# Altium project MVP-Dash-v1.0.PrjPcb (part 15 of 15)

## Sheet Connector-Sheet.SchDoc
size 420 x 297 mm; SheetNumber: 25; SheetTotal: 25
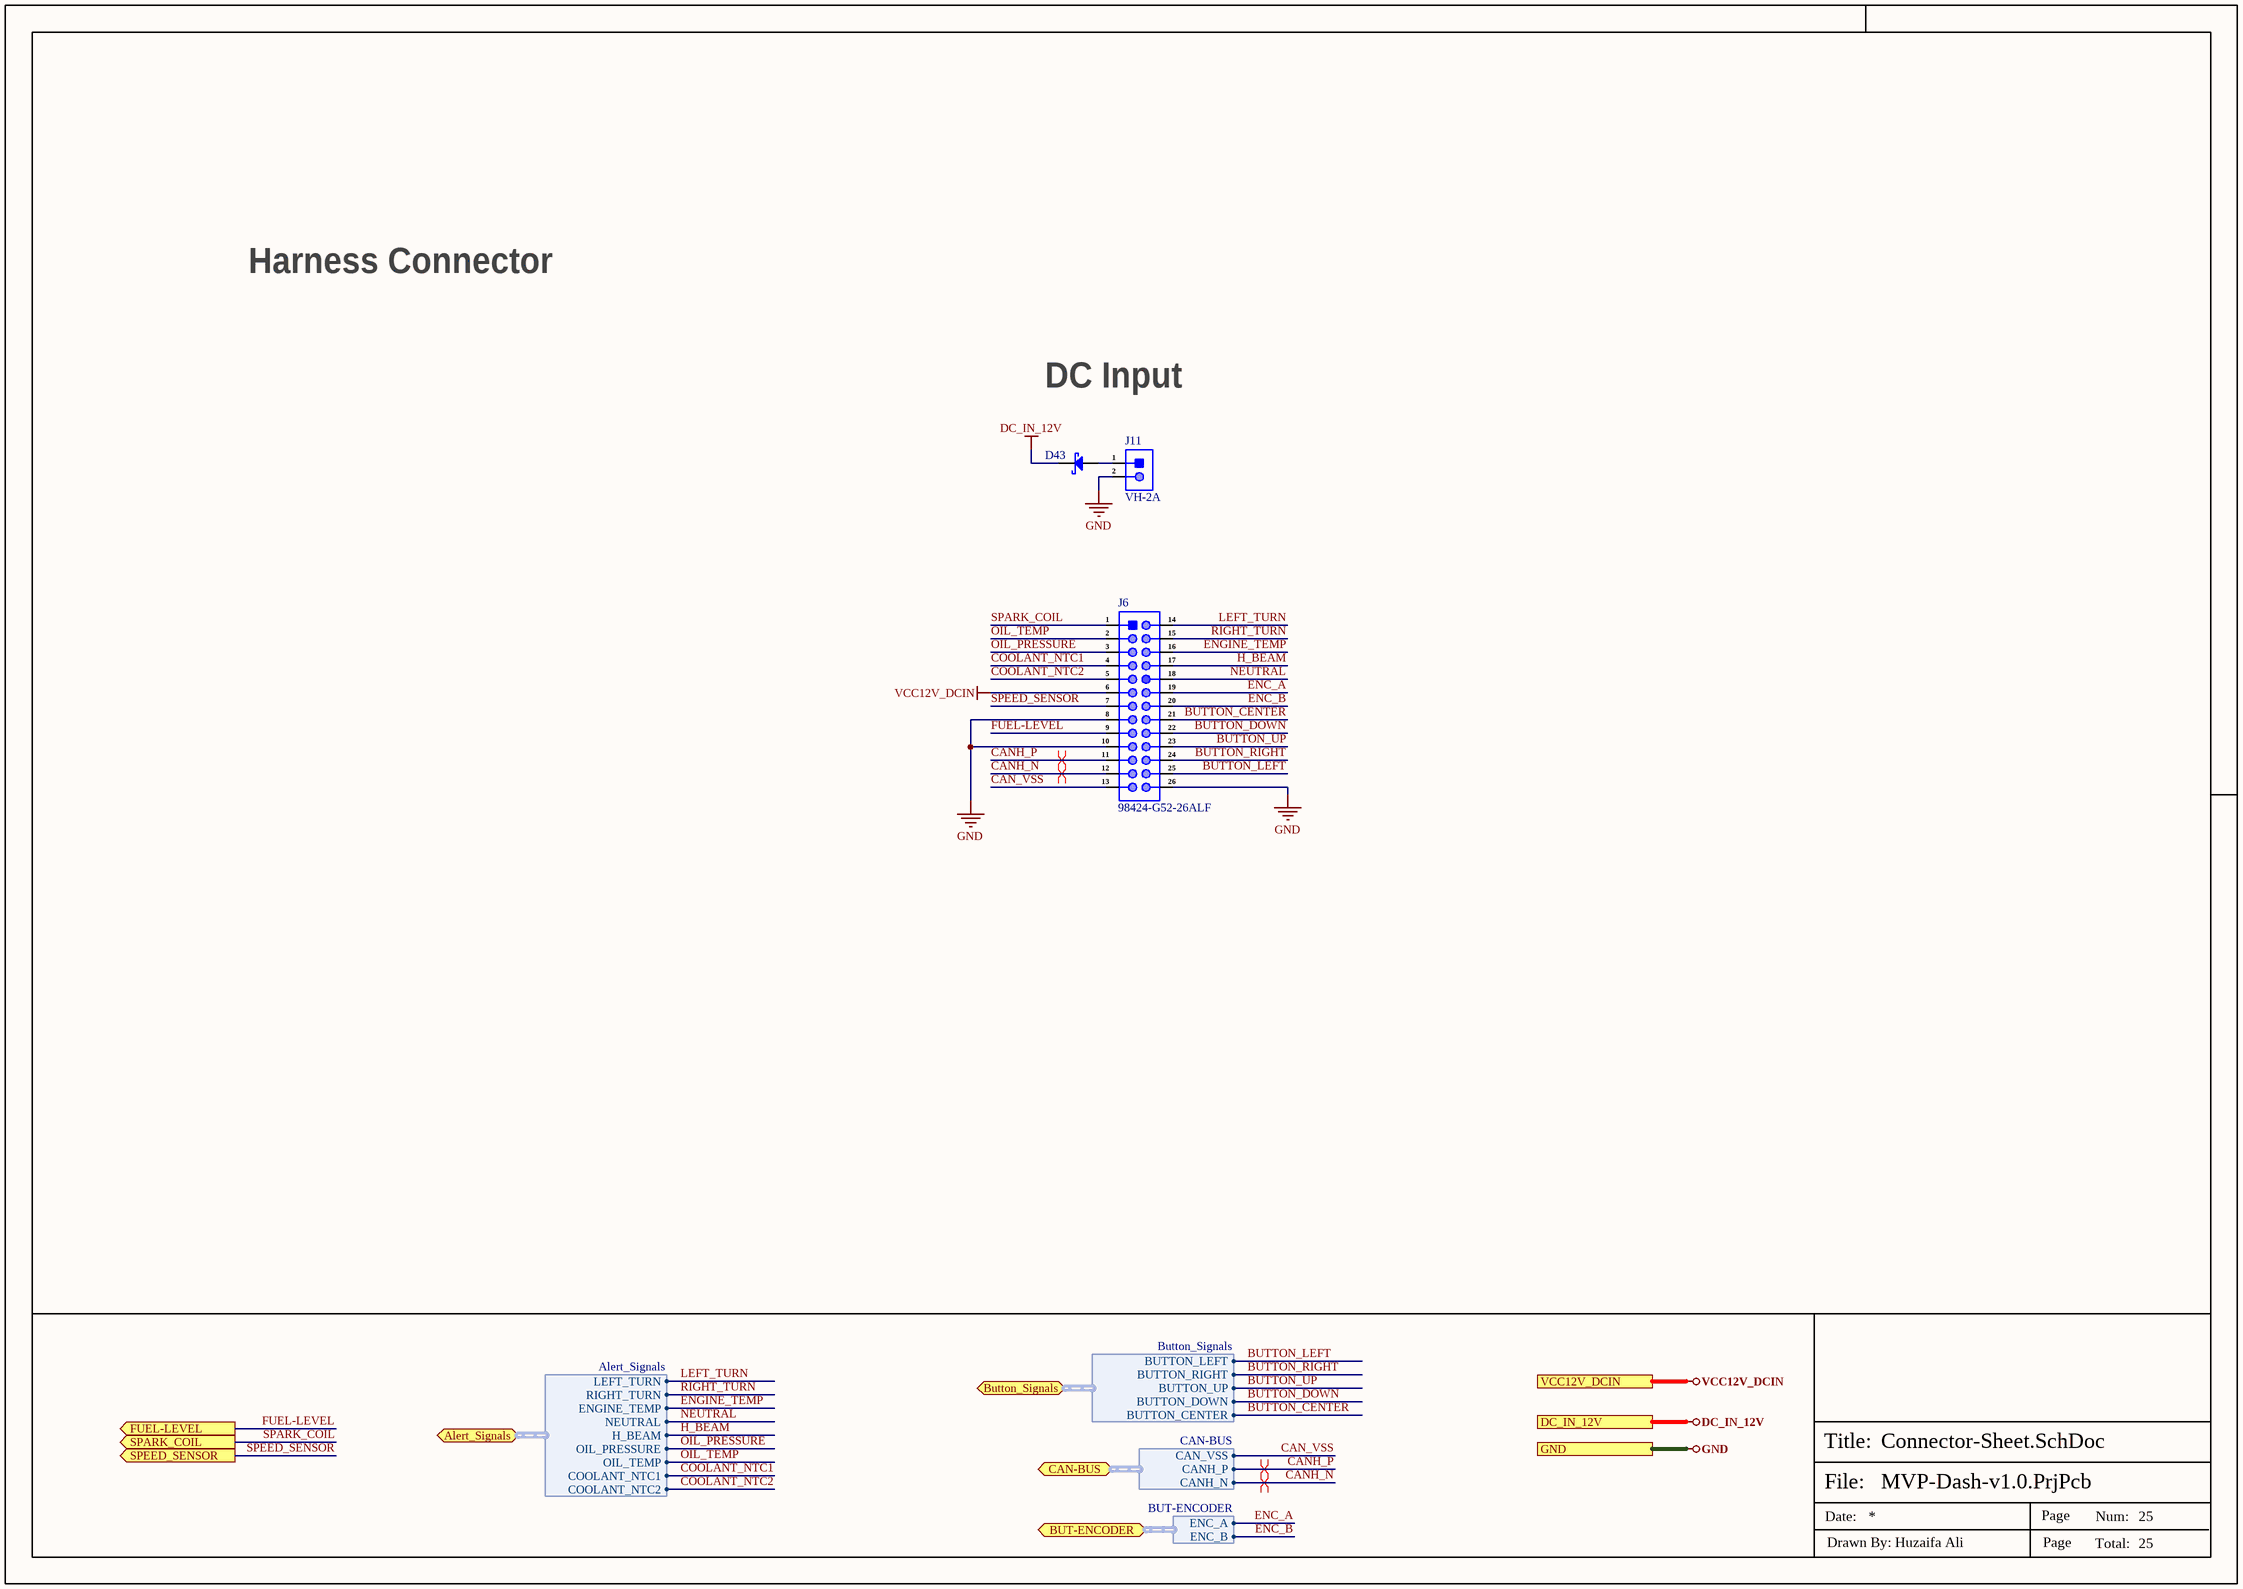
[diagram p32: Connector-Sheet.SchDoc]

### Parts
D43  SS34  [SMA]  (value not drawn)
J6  98424-G52-26ALF  [98424-G52-26ALF]
J11  VH-2A  [VH-2A]

### Ports
Alert_Signals (bidir, harness Alert_Signals, see Sensors-Sheet-2[1D]), BUT-ENCODER (bidir, harness BUT-ENCODER, see Sensors-Sheet-2[4D]), Button_Signals (bidir, harness Button_Signals, see Sensors-Sheet-2[2D]), CAN-BUS (bidir, harness CAN-BUS, see CAN-Bus-SPI-Flash-Sheet[4D]), DC_IN_12V (see Power-DC-IN-Sheet[4D]), FUEL-LEVEL (out, see Sensors-Sheet-1[3D]), GND (see CAN-Bus-SPI-Flash-Sheet[4D], DRAM-LPDDR4x-Sheet[4D], eMMC-Sheet[4D], LED-Debug-Sheet[4D], Power-DC-IN-Sheet[4D], Power-Others-Sheet[4D], Power-PMIC-Sheet[4D], RK3568-Audio-Interface[4D], RK3568-Flash-SD-Controller[4D], RK3568-OSC-PMUIO-Sheet[5D], RK3568-Power-Sheet[4D], RK3568-SARADC-GPIO[4D], RK3568-USB-PCIe-Sheet[5D], RK3568-VI-Interface-Sheet[4D], RK3568-VO-Interface-1[4D], RK3568-VO-Interface-2[4D], Sensors-Sheet-1[4D], Sensors-Sheet-2[5D], Type-C-Sheet[4D], USB-Ports[4D], VO-HDMI2.0-TX-Sheet[4D], VO-LCM-MIPI-DSI-TX0[4D], WIFI-BT-SDIO-Sheet[4D]), SPARK_COIL (out, see Sensors-Sheet-1[3D]), SPEED_SENSOR (out, see Sensors-Sheet-1[3D]), VCC12V_DCIN (see Power-DC-IN-Sheet[4D], Sensors-Sheet-1[4D], Sensors-Sheet-2[5D])

### Harnesses
Button_Signals: BUTTON_LEFT, BUTTON_RIGHT, BUTTON_UP, BUTTON_DOWN, BUTTON_CENTER
Alert_Signals: LEFT_TURN, RIGHT_TURN, ENGINE_TEMP, NEUTRAL, H_BEAM, OIL_PRESSURE, OIL_TEMP, COOLANT_NTC1, COOLANT_NTC2
CAN-BUS: CAN_VSS, CANH_P, CANH_N
BUT-ENCODER: ENC_A, ENC_B

### Nets
DC_IN_12V: D43.1(K) ; port DC_IN_12V
GND: J6.8 J6.10 J6.26 J11.2 ; port GND
VCC12V_DCIN: J6.6 ; port VCC12V_DCIN
BUTTON_CENTER: J6.21 ; port Button_Signals.BUTTON_CENTER
BUTTON_DOWN: J6.22 ; port Button_Signals.BUTTON_DOWN
BUTTON_LEFT: J6.25 ; port Button_Signals.BUTTON_LEFT
BUTTON_RIGHT: J6.24 ; port Button_Signals.BUTTON_RIGHT
BUTTON_UP: J6.23 ; port Button_Signals.BUTTON_UP
CAN_VSS: J6.13 ; port CAN-BUS.CAN_VSS
CANH_N: J6.12 ; port CAN-BUS.CANH_N
CANH_P: J6.11 ; port CAN-BUS.CANH_P
COOLANT_NTC1: J6.4 ; port Alert_Signals.COOLANT_NTC1
COOLANT_NTC2: J6.5 ; port Alert_Signals.COOLANT_NTC2
ENC_A: J6.19 ; port BUT-ENCODER.ENC_A
ENC_B: J6.20 ; port BUT-ENCODER.ENC_B
ENGINE_TEMP: J6.16 ; port Alert_Signals.ENGINE_TEMP
FUEL-LEVEL: J6.9 ; port FUEL-LEVEL
H_BEAM: J6.17 ; port Alert_Signals.H_BEAM
LEFT_TURN: J6.14 ; port Alert_Signals.LEFT_TURN
NEUTRAL: J6.18 ; port Alert_Signals.NEUTRAL
OIL_PRESSURE: J6.3 ; port Alert_Signals.OIL_PRESSURE
OIL_TEMP: J6.2 ; port Alert_Signals.OIL_TEMP
RIGHT_TURN: J6.15 ; port Alert_Signals.RIGHT_TURN
SPARK_COIL: J6.1 ; port SPARK_COIL
SPEED_SENSOR: J6.7 ; port SPEED_SENSOR
NetD43_2: D43.2(A) J11.1

### Layout directives
differential pair: CANH_N, CANH_P

### Notes on the sheet
- Harness Connector
- DC Input
- File:
- Title:
- Date:
- Page
- Num:
- Total:
- Drawn By: Huzaifa Ali

### Library data of the parts
D43 = SS34: 0.5mA@40V 40V Single 3A 0.55V@3A SMA(DO-214AC) Schottky Barrier Diodes (SBD) ROHS; Manufacturer: MDD; Item Type: Diode; Manufacturer Part Number: SS34; Package: SMA(DO-214AC); LCSC Part Number: C8678; ComponentLink1Description: LCSC; ComponentLink1URL: https://www.lcsc.com/product-detail/Schottky-Barrier-Diodes-SBD_MDD-Microdiode-Electronics-SS34_C8678.html
J6 = 98424-G52-26ALF: CONN HEADER SMD 26POS 2MM; Manufacturer: Amphenol ICC / FCI; Item Type: Headers and Wire Housings; Supplier: Avnet; Supplier Part Number: 65AC3204; Manufacturer Part Number: 98424-G52-26ALF; RoHS: Yes; Stock: 29; Pricing: 1=1.91 (USD); ComponentLink1URL: https://datasheet.ciiva.com/713/98424-713391.pdf?src-supplier=Digikey; ComponentLink1Description: https://datasheet.ciiva.com/713/98424-713391.pdf?src-supplier=Digikey; ComponentLink2URL: https://datasheet.ciiva.com/713/98424-713392.pdf?src-supplier=Digikey; ComponentLink2Description: https://datasheet.ciiva.com/713/98424-713392.pdf?src-supplier=Digikey; ComponentLink3URL: https://datasheet.ciiva.com/9473/98424-9473029.pdf?src-supplier=Avnet; ComponentLink3Description: https://datasheet.ciiva.com/9473/98424-9473029.pdf?src-supplier=Avnet; ComponentLink4URL: https://datasheet.ciiva.com/729/98424-729327.pdf?src-supplier=Digikey; ComponentLink4Description: https://datasheet.ciiva.com/729/98424-729327.pdf?src-supplier=Digikey; LCSC Part Number: C213188
J11 = VH-2A: 2.00mm Pitch MicroClasp Wire-to-Board Header, Dual Row, Vertical, 24 Circuits, with PCB Locator; Manufacturer: BOOMELE; Item Type: Wire To Board Connector; Manufacturer Part Number: VH-2A; Package: Push-Pull,P=3.96mm; LCSC Part Number: C80347; ComponentLink1Description: LCSC; ComponentLink1URL: https://www.lcsc.com/product-detail/Wire-To-Board-span-style-background-color-ff0-Connector-span_BOOMELE-Boom-Precision-Elec-VH-2A_C80347.html; Supplier: Mouser; Supplier Part Number: 538-55917-2410; RoHS: Yes; Category: Headers and Wire Housings; Stock: 3772; Pricing: 1=1.36, 10=1.15, 50=1.15, 100=1.03, 1000=0.849, 10000=0.66 (USD); ComponentLink2URL: https://datasheet.ciiva.com/5156/0559172410-pcb-headers-171124-5156321.pdf?src-supplier=Mouser; ComponentLink2Description: https://datasheet.ciiva.com/5156/0559172410-pcb-headers-171124-5156321.pdf?src-supplier=Mouser

## Nets that join several sheets
DC_IN_12V: Power-DC-IN-Sheet (C3.2 F1.1 P2.1 R3.2), Connector-Sheet (D43.1)
GND: Power-DC-IN-Sheet (36 pins), Power-PMIC-Sheet (60 pins), Power-Others-Sheet (13 pins), RK3568-Power-Sheet (225 pins), RK3568-DDR-PHY (11 pins), RK3568-OSC-PMUIO-Sheet (22 pins), RK3568-Flash-SD-Controller (C133.1 C134.1 P13.1 SW3.2), RK3568-USB-PCIe-Sheet (16 pins), RK3568-SARADC-GPIO (19 pins), RK3568-VI-Interface-Sheet (7 pins), RK3568-VO-Interface-1 (18 pins), RK3568-VO-Interface-2 (C187.1 C188.2), RK3568-Audio-Interface (C189.1), USB-Ports (12 pins), LED-Debug-Sheet (10 pins), DRAM-LPDDR4x-Sheet (115 pins), eMMC-Sheet (21 pins), CAN-Bus-SPI-Flash-Sheet (13 pins), VO-LCM-MIPI-DSI-TX0 (19 pins), VO-HDMI2.0-TX-Sheet (15 pins), WIFI-BT-SDIO-Sheet (20 pins), Type-C-Sheet (37 pins), Sensors-Sheet-1 (37 pins), Sensors-Sheet-2 (30 pins), Connector-Sheet (J6.8 J6.10 J6.26 J11.2)
VCC0V6_DDR: RK3568-DDR-PHY (11 pins), DRAM-LPDDR4x-Sheet (46 pins)
VCC3V3_PMU: Power-PMIC-Sheet (C72.2 R23.2 U6.31), Power-Others-Sheet (R34.2 R39.1), RK3568-OSC-PMUIO-Sheet (9 pins), Type-C-Sheet (R178.2)
VCC3V3_S: Power-DC-IN-Sheet (7 pins), VO-LCM-MIPI-DSI-TX0 (C270.2 C271.2 J8.3), WIFI-BT-SDIO-Sheet (FB2.1), Type-C-Sheet (C290.1 U19.17 U20.3 U20.4), Sensors-Sheet-1 (12 pins), Sensors-Sheet-2 (22 pins)
VCC3V3_SD: Power-PMIC-Sheet (C76.2 U6.58), CAN-Bus-SPI-Flash-Sheet (C261.2 C262.2 U1.5)
VCC3V3_SYS: Power-DC-IN-Sheet (7 pins), Power-PMIC-Sheet (18 pins), RK3568-SARADC-GPIO (C153.1 R59.1 U9.1), DRAM-LPDDR4x-Sheet (C196.2 U11.4)
VCC5V0_SYS: Power-DC-IN-Sheet (10 pins), Power-PMIC-Sheet (FB1.1), Power-Others-Sheet (5 pins), CAN-Bus-SPI-Flash-Sheet (C260.2 C316.2 U1.3), VO-LCM-MIPI-DSI-TX0 (C267.2 L11.1 U16.6), VO-HDMI2.0-TX-Sheet (C264.2 U15.3), Sensors-Sheet-1 (C305.2 U21.8)
VCC5V0_USB: Power-DC-IN-Sheet (R12.2), USB-Ports (C190.2 U10.5)
VCC5V0_USB_C: Power-DC-IN-Sheet (R13.2), Type-C-Sheet (5 pins)
VCC12V_DCIN: Power-DC-IN-Sheet (16 pins), Sensors-Sheet-1 (7 pins), Sensors-Sheet-2 (R207.1 R208.1 R213.1 R215.1), Connector-Sheet (J6.6)
VCC_1V8: Power-PMIC-Sheet (5 pins), Power-Others-Sheet (R38.1), RK3568-SARADC-GPIO (C154.2 U8.H20), RK3568-VI-Interface-Sheet (6 pins), WIFI-BT-SDIO-Sheet (R140.1)
VCC_3V3: Power-PMIC-Sheet (C77.2 U6.55), RK3568-OSC-PMUIO-Sheet (R51.2), RK3568-USB-PCIe-Sheet (C140.2 C143.2 U8.M23 U8.P10), RK3568-SARADC-GPIO (C151.2 U8.V12), RK3568-VO-Interface-2 (6 pins), LED-Debug-Sheet (LED1.1 LED2.1), eMMC-Sheet (7 pins), VO-HDMI2.0-TX-Sheet (5 pins), WIFI-BT-SDIO-Sheet (R143.2)
VCC_5V_S: Power-DC-IN-Sheet (C21.2 R14.1 U4.3), Power-PMIC-Sheet (R30.2)
VCC_DDR: Power-PMIC-Sheet (5 pins), RK3568-DDR-PHY (14 pins), DRAM-LPDDR4x-Sheet (46 pins)
VCCA1V8_IMAGE: Power-PMIC-Sheet (C75.2 U6.6), RK3568-VI-Interface-Sheet (C164.2 C166.1 U8.Y14), RK3568-VO-Interface-1 (12 pins)
VCCA1V8_PMU: Power-PMIC-Sheet (C74.2 U6.5), RK3568-OSC-PMUIO-Sheet (C120.1 C125.2 R42.2 U8.Y21), DRAM-LPDDR4x-Sheet (R104.1)
VCCA_1V8: Power-PMIC-Sheet (C73.2 U6.3), RK3568-OSC-PMUIO-Sheet (C122.1 C127.2 U8.N10), RK3568-USB-PCIe-Sheet (10 pins), RK3568-SARADC-GPIO (9 pins), LED-Debug-Sheet (R97.1)
VCCIO_ACODEC: Power-PMIC-Sheet (C70.2 U6.28), RK3568-Audio-Interface (C189.2 R82.2 R83.2 U8.H17)
VCCIO_FLASH: Power-Others-Sheet (C87.2 R38.2), RK3568-Flash-SD-Controller (C133.2 U8.H18), eMMC-Sheet (12 pins), CAN-Bus-SPI-Flash-Sheet (5 pins)
VCCIO_SD: Power-PMIC-Sheet (C71.2 U6.29), RK3568-Flash-SD-Controller (C134.2 U8.L22)
VCCIO_WL: Power-PMIC-Sheet (R17.1), WIFI-BT-SDIO-Sheet (12 pins)
VDD_CPU: Power-Others-Sheet (8 pins), RK3568-Power-Sheet (15 pins)
VDD_GPU: Power-PMIC-Sheet (9 pins), RK3568-Power-Sheet (10 pins)
VDD_LOGIC: Power-PMIC-Sheet (9 pins), RK3568-Power-Sheet (16 pins)
VDD_NPU: Power-PMIC-Sheet (9 pins), RK3568-Power-Sheet (9 pins)
VDDA0V9_IMAGE: Power-PMIC-Sheet (C67.2 U6.23), RK3568-VI-Interface-Sheet (C165.2 C167.1 U8.W14), RK3568-VO-Interface-1 (13 pins)
VDDA0V9_PMU: Power-PMIC-Sheet (C69.2 U6.20), RK3568-OSC-PMUIO-Sheet (6 pins)
VDDA_0V9: Power-PMIC-Sheet (C68.2 U6.21), RK3568-OSC-PMUIO-Sheet (C121.1 C126.2 U8.P11), RK3568-USB-PCIe-Sheet (12 pins)
A_A0: RK3568-DDR-PHY (U8.C2), DRAM-LPDDR4x-Sheet (U12.H2)
A_A1: RK3568-DDR-PHY (U8.B1), DRAM-LPDDR4x-Sheet (U12.J2)
A_A2: RK3568-DDR-PHY (U8.E4), DRAM-LPDDR4x-Sheet (U12.H9)
A_A3: RK3568-DDR-PHY (U8.C4), DRAM-LPDDR4x-Sheet (U12.H10)
A_A4: RK3568-DDR-PHY (U8.C5), DRAM-LPDDR4x-Sheet (U12.H11)
A_A5: RK3568-DDR-PHY (U8.D5), DRAM-LPDDR4x-Sheet (U12.J11)
A_CLK_N: RK3568-DDR-PHY (U8.A4), DRAM-LPDDR4x-Sheet (U12.J9)
A_CLK_P: RK3568-DDR-PHY (U8.B4), DRAM-LPDDR4x-Sheet (U12.J8)
A_CLKE0: RK3568-DDR-PHY (U8.B3), DRAM-LPDDR4x-Sheet (U12.J4)
A_CLKE1: RK3568-DDR-PHY (U8.F4), DRAM-LPDDR4x-Sheet (U12.J5)
A_CS0: RK3568-DDR-PHY (U8.A2), DRAM-LPDDR4x-Sheet (U12.H4)
A_CS1: RK3568-DDR-PHY (U8.B2), DRAM-LPDDR4x-Sheet (U12.H3)
A_DM0: RK3568-DDR-PHY (U8.H5), DRAM-LPDDR4x-Sheet (U12.C3)
A_DM1: RK3568-DDR-PHY (U8.J4), DRAM-LPDDR4x-Sheet (U12.C10)
A_DQ0: RK3568-DDR-PHY (U8.F2), DRAM-LPDDR4x-Sheet (U12.B2)
A_DQ1: RK3568-DDR-PHY (U8.E1), DRAM-LPDDR4x-Sheet (U12.C2)
A_DQ2: RK3568-DDR-PHY (U8.E2), DRAM-LPDDR4x-Sheet (U12.E2)
A_DQ3: RK3568-DDR-PHY (U8.D1), DRAM-LPDDR4x-Sheet (U12.F2)
A_DQ4: RK3568-DDR-PHY (U8.J1), DRAM-LPDDR4x-Sheet (U12.F4)
A_DQ5: RK3568-DDR-PHY (U8.J2), DRAM-LPDDR4x-Sheet (U12.E4)
A_DQ6: RK3568-DDR-PHY (U8.H1), DRAM-LPDDR4x-Sheet (U12.C4)
A_DQ7: RK3568-DDR-PHY (U8.H4), DRAM-LPDDR4x-Sheet (U12.B4)
A_DQ8: RK3568-DDR-PHY (U8.M1), DRAM-LPDDR4x-Sheet (U12.B11)
A_DQ9: RK3568-DDR-PHY (U8.N2), DRAM-LPDDR4x-Sheet (U12.C11)
A_DQ10: RK3568-DDR-PHY (U8.L7), DRAM-LPDDR4x-Sheet (U12.E11)
A_DQ11: RK3568-DDR-PHY (U8.L6), DRAM-LPDDR4x-Sheet (U12.F11)
A_DQ12: RK3568-DDR-PHY (U8.K2), DRAM-LPDDR4x-Sheet (U12.F9)
A_DQ13: RK3568-DDR-PHY (U8.J6), DRAM-LPDDR4x-Sheet (U12.E9)
A_DQ14: RK3568-DDR-PHY (U8.J7), DRAM-LPDDR4x-Sheet (U12.C9)
A_DQ15: RK3568-DDR-PHY (U8.L4), DRAM-LPDDR4x-Sheet (U12.B9)
A_DQS0_N: RK3568-DDR-PHY (U8.G2), DRAM-LPDDR4x-Sheet (U12.E3)
A_DQS0_P: RK3568-DDR-PHY (U8.G1), DRAM-LPDDR4x-Sheet (U12.D3)
A_DQS1_N: RK3568-DDR-PHY (U8.L1), DRAM-LPDDR4x-Sheet (U12.E10)
A_DQS1_P: RK3568-DDR-PHY (U8.L2), DRAM-LPDDR4x-Sheet (U12.D10)
A_ODT0_CA: RK3568-DDR-PHY (U8.C1), DRAM-LPDDR4x-Sheet (U12.G2)
A_RESET: RK3568-DDR-PHY (U8.F11), DRAM-LPDDR4x-Sheet (C238.2 U12.T11)
B_A0: RK3568-DDR-PHY (U8.B8), DRAM-LPDDR4x-Sheet (U12.R2)
B_A1: RK3568-DDR-PHY (U8.A7), DRAM-LPDDR4x-Sheet (U12.P2)
B_A2: RK3568-DDR-PHY (U8.E11), DRAM-LPDDR4x-Sheet (U12.R9)
B_A3: RK3568-DDR-PHY (U8.D9), DRAM-LPDDR4x-Sheet (U12.R10)
B_A4: RK3568-DDR-PHY (U8.E9), DRAM-LPDDR4x-Sheet (U12.R11)
B_A5: RK3568-DDR-PHY (U8.B7), DRAM-LPDDR4x-Sheet (U12.P11)
B_CLK_N: RK3568-DDR-PHY (U8.A5), DRAM-LPDDR4x-Sheet (U12.P9)
B_CLK_P: RK3568-DDR-PHY (U8.B6), DRAM-LPDDR4x-Sheet (U12.P8)
B_CLKE0: RK3568-DDR-PHY (U8.D6), DRAM-LPDDR4x-Sheet (U12.P4)
B_CLKE1: RK3568-DDR-PHY (U8.E6), DRAM-LPDDR4x-Sheet (U12.P5)
B_CS0: RK3568-DDR-PHY (U8.D8), DRAM-LPDDR4x-Sheet (U12.R4)
B_CS1: RK3568-DDR-PHY (U8.E8), DRAM-LPDDR4x-Sheet (U12.R3)
B_DM0: RK3568-DDR-PHY (U8.D14), DRAM-LPDDR4x-Sheet (U12.Y3)
B_DM1: RK3568-DDR-PHY (U8.E17), DRAM-LPDDR4x-Sheet (U12.Y10)
B_DQ0: RK3568-DDR-PHY (U8.B10), DRAM-LPDDR4x-Sheet (U12.AA2)
B_DQ1: RK3568-DDR-PHY (U8.A9), DRAM-LPDDR4x-Sheet (U12.Y2)
B_DQ2: RK3568-DDR-PHY (U8.D12), DRAM-LPDDR4x-Sheet (U12.V2)
B_DQ3: RK3568-DDR-PHY (U8.E12), DRAM-LPDDR4x-Sheet (U12.U2)
B_DQ4: RK3568-DDR-PHY (U8.A12), DRAM-LPDDR4x-Sheet (U12.U4)
B_DQ5: RK3568-DDR-PHY (U8.D15), DRAM-LPDDR4x-Sheet (U12.V4)
B_DQ6: RK3568-DDR-PHY (U8.E15), DRAM-LPDDR4x-Sheet (U12.Y4)
B_DQ7: RK3568-DDR-PHY (U8.E14), DRAM-LPDDR4x-Sheet (U12.AA4)
B_DQ8: RK3568-DDR-PHY (U8.A16), DRAM-LPDDR4x-Sheet (U12.AA11)
B_DQ9: RK3568-DDR-PHY (U8.B17), DRAM-LPDDR4x-Sheet (U12.Y11)
B_DQ10: RK3568-DDR-PHY (U8.A17), DRAM-LPDDR4x-Sheet (U12.V11)
B_DQ11: RK3568-DDR-PHY (U8.B18), DRAM-LPDDR4x-Sheet (U12.U11)
B_DQ12: RK3568-DDR-PHY (U8.B13), DRAM-LPDDR4x-Sheet (U12.U9)
B_DQ13: RK3568-DDR-PHY (U8.A13), DRAM-LPDDR4x-Sheet (U12.V9)
B_DQ14: RK3568-DDR-PHY (U8.D17), DRAM-LPDDR4x-Sheet (U12.Y9)
B_DQ15: RK3568-DDR-PHY (U8.B14), DRAM-LPDDR4x-Sheet (U12.AA9)
B_DQS0_N: RK3568-DDR-PHY (U8.B11), DRAM-LPDDR4x-Sheet (U12.V3)
B_DQS0_P: RK3568-DDR-PHY (U8.A11), DRAM-LPDDR4x-Sheet (U12.W3)
B_DQS1_N: RK3568-DDR-PHY (U8.A15), DRAM-LPDDR4x-Sheet (U12.V10)
B_DQS1_P: RK3568-DDR-PHY (U8.B15), DRAM-LPDDR4x-Sheet (U12.W10)
B_ODT0_CA: RK3568-DDR-PHY (U8.A8), DRAM-LPDDR4x-Sheet (U12.T2)
BL_EN0_GPIO3_B0: RK3568-VO-Interface-2 (U8.AG2), VO-LCM-MIPI-DSI-TX0 (D18.1 D18.10 R133.2)
BUTTON_CENTER: Sensors-Sheet-2 (R232.1 U34.5), Connector-Sheet (J6.21)
BUTTON_DOWN: Sensors-Sheet-2 (R231.1 U34.4), Connector-Sheet (J6.22)
BUTTON_LEFT: Sensors-Sheet-2 (R228.1 U34.1), Connector-Sheet (J6.25)
BUTTON_RIGHT: Sensors-Sheet-2 (R229.1 U34.2), Connector-Sheet (J6.24)
BUTTON_UP: Sensors-Sheet-2 (R230.1 U34.3), Connector-Sheet (J6.23)
CAN0_RX_M1: RK3568-Flash-SD-Controller (U8.H28), CAN-Bus-SPI-Flash-Sheet (R111.2)
CAN0_TX_M1: RK3568-Flash-SD-Controller (U8.H27), CAN-Bus-SPI-Flash-Sheet (R110.2)
CAN_VSS: CAN-Bus-SPI-Flash-Sheet (C317.2 C318.2 FB5.2), Connector-Sheet (J6.13)
CANH_N: CAN-Bus-SPI-Flash-Sheet (D42.1 R114.1 R116.2), Connector-Sheet (J6.12)
CANH_P: CAN-Bus-SPI-Flash-Sheet (D12.1 R113.1 R115.2), Connector-Sheet (J6.11)
COOLANT_NTC1: Sensors-Sheet-2 (R1.2), Connector-Sheet (J6.4)
COOLANT_NTC2: Sensors-Sheet-2 (R2.1 U33.4), Connector-Sheet (J6.5)
eMMC_CLK: RK3568-Flash-SD-Controller (R53.1), eMMC-Sheet (U13.M6)
eMMC_CMD: RK3568-Flash-SD-Controller (U8.B22), eMMC-Sheet (R106.2 U13.M5)
eMMC_DATA0: RK3568-Flash-SD-Controller (SW3.1 U8.A24), eMMC-Sheet (R105.2 U13.A3)
eMMC_DATA1: RK3568-Flash-SD-Controller (P11.1 U8.C21), eMMC-Sheet (U13.A4)
eMMC_DATA2: RK3568-Flash-SD-Controller (U8.B24), eMMC-Sheet (U13.A5)
eMMC_DATA3: RK3568-Flash-SD-Controller (U8.D21), eMMC-Sheet (U13.B2)
eMMC_DATA4: RK3568-Flash-SD-Controller (U8.A25), eMMC-Sheet (U13.B3)
eMMC_DATA5: RK3568-Flash-SD-Controller (U8.E21), eMMC-Sheet (U13.B4)
eMMC_DATA6: RK3568-Flash-SD-Controller (U8.E22), eMMC-Sheet (U13.B5)
eMMC_DATA7: RK3568-Flash-SD-Controller (U8.B25), eMMC-Sheet (U13.B6)
eMMC_DATA_STROBE: RK3568-Flash-SD-Controller (U8.A26), eMMC-Sheet (R108.2 U13.H5)
ENC_A: Sensors-Sheet-2 (R109.1 U34.6), Connector-Sheet (J6.19)
ENC_B: Sensors-Sheet-2 (R216.1 U34.7), Connector-Sheet (J6.20)
ENGINE_TEMP: Sensors-Sheet-2 (D37.2), Connector-Sheet (J6.16)
EXT_EN: Power-DC-IN-Sheet (R4.1 R5.1), Power-PMIC-Sheet (U6.60)
FLASH_VOL_SEL: Power-Others-Sheet (R39.2), RK3568-OSC-PMUIO-Sheet (U8.AG25)
FSPI_CLK: RK3568-Flash-SD-Controller (R54.1), CAN-Bus-SPI-Flash-Sheet (SW5.1 U14.6)
FSPI_CS0n: RK3568-Flash-SD-Controller (U8.C23), CAN-Bus-SPI-Flash-Sheet (R117.1 U14.1)
FSPI_D0: RK3568-Flash-SD-Controller (P12.1 U8.C24), CAN-Bus-SPI-Flash-Sheet (U14.5)
FSPI_D1: RK3568-Flash-SD-Controller (U8.D23), CAN-Bus-SPI-Flash-Sheet (U14.2)
FSPI_D2: RK3568-Flash-SD-Controller (R56.2), CAN-Bus-SPI-Flash-Sheet (R118.1 U14.3)
FSPI_D3: RK3568-Flash-SD-Controller (U8.A27), CAN-Bus-SPI-Flash-Sheet (R119.1 U14.7)
FUEL-LEVEL: Sensors-Sheet-1 (5 pins), Connector-Sheet (J6.9)
H_BEAM: Sensors-Sheet-2 (R214.1), Connector-Sheet (J6.17)
HDMI_TX0_N: RK3568-VO-Interface-1 (R76.2), VO-HDMI2.0-TX-Sheet (D14.1 D14.10 J7.11)
HDMI_TX0_P: RK3568-VO-Interface-1 (R75.2), VO-HDMI2.0-TX-Sheet (D14.2 D14.9 J7.9)
HDMI_TX1_N: RK3568-VO-Interface-1 (R74.2), VO-HDMI2.0-TX-Sheet (D15.4 D15.7 J7.8)
HDMI_TX1_P: RK3568-VO-Interface-1 (R73.2), VO-HDMI2.0-TX-Sheet (D15.5 D15.6 J7.6)
HDMI_TX2_N: RK3568-VO-Interface-1 (R72.2), VO-HDMI2.0-TX-Sheet (D14.4 D14.7 J7.5)
HDMI_TX2_P: RK3568-VO-Interface-1 (R71.2), VO-HDMI2.0-TX-Sheet (D14.5 D14.6 J7.3)
HDMI_TXCLK_N: RK3568-VO-Interface-1 (R78.2), VO-HDMI2.0-TX-Sheet (D15.1 D15.10 J7.14)
HDMI_TXCLK_P: RK3568-VO-Interface-1 (R77.2), VO-HDMI2.0-TX-Sheet (D15.2 D15.9 J7.12)
HDMITX_SCL: RK3568-SARADC-GPIO (U8.AG8), VO-HDMI2.0-TX-Sheet (Q3.2 R120.1)
HDMITX_SDA: RK3568-SARADC-GPIO (U8.AG7), VO-HDMI2.0-TX-Sheet (Q4.2 R121.1)
I2C0_SCL_PMIC: Power-PMIC-Sheet (R25.2), Power-Others-Sheet (U7.A3), RK3568-OSC-PMUIO-Sheet (R46.1 U8.AF24), Type-C-Sheet (U20.6)
I2C0_SDA_PMIC: Power-PMIC-Sheet (R24.2), Power-Others-Sheet (U7.B1), RK3568-OSC-PMUIO-Sheet (R47.1 U8.AB21), Type-C-Sheet (U20.7)
I2C3_SCL_M0: RK3568-Audio-Interface (R82.1 U8.E18), Sensors-Sheet-1 (U25.10), Sensors-Sheet-2 (U33.10 U34.12 U35.6)
I2C3_SDA_M0: RK3568-Audio-Interface (R83.1 U8.D18), Sensors-Sheet-1 (U25.9), Sensors-Sheet-2 (U33.9 U34.13 U35.7)
I2S1_LRCK_TX_M0_RK809: Power-PMIC-Sheet (U6.14), RK3568-Audio-Interface (U8.A20)
I2S1_MCLK_M0_RK809: Power-PMIC-Sheet (U6.16), RK3568-Audio-Interface (U8.A19)
I2S1_SCLK_TX_M0_RK809: Power-PMIC-Sheet (U6.15), RK3568-Audio-Interface (U8.B19)
I2S1_SDI0_M0/PDM_SDI0_M0_RK809: Power-PMIC-Sheet (U6.18), RK3568-Audio-Interface (U8.B21)
I2S1_SDO0_M0_RK809: Power-PMIC-Sheet (U6.17), RK3568-Audio-Interface (U8.B20)
INTA_PORT: RK3568-OSC-PMUIO-Sheet (U8.AD22), Sensors-Sheet-2 (R221.1 U34.20)
INTB_PORT: RK3568-OSC-PMUIO-Sheet (U8.AD20), Sensors-Sheet-2 (R222.1 U34.19)
LCD0_BL_PWM4: RK3568-OSC-PMUIO-Sheet (U8.AE23), VO-LCM-MIPI-DSI-TX0 (D18.2 D18.9 R130.1)
LCD0_RST_GPIO3_B5: RK3568-VO-Interface-2 (U8.AE2), VO-LCM-MIPI-DSI-TX0 (D18.4 D18.7 J8.5)
LEFT_TURN: Sensors-Sheet-2 (R205.1), Connector-Sheet (J6.14)
MIPI_DSI_TX0_CLK_N: RK3568-VO-Interface-1 (U8.AG15), VO-LCM-MIPI-DSI-TX0 (J8.18)
MIPI_DSI_TX0_CLK_P: RK3568-VO-Interface-1 (U8.AH15), VO-LCM-MIPI-DSI-TX0 (J8.17)
MIPI_DSI_TX0_D0_N: RK3568-VO-Interface-1 (U8.AG17), VO-LCM-MIPI-DSI-TX0 (J8.24)
MIPI_DSI_TX0_D0_P: RK3568-VO-Interface-1 (U8.AH17), VO-LCM-MIPI-DSI-TX0 (J8.23)
MIPI_DSI_TX0_D1_N: RK3568-VO-Interface-1 (U8.AG16), VO-LCM-MIPI-DSI-TX0 (J8.21)
MIPI_DSI_TX0_D1_P: RK3568-VO-Interface-1 (U8.AH16), VO-LCM-MIPI-DSI-TX0 (J8.20)
MIPI_DSI_TX0_D2_N: RK3568-VO-Interface-1 (U8.AG14), VO-LCM-MIPI-DSI-TX0 (J8.15)
MIPI_DSI_TX0_D2_P: RK3568-VO-Interface-1 (U8.AH14), VO-LCM-MIPI-DSI-TX0 (J8.14)
MIPI_DSI_TX0_D3_N: RK3568-VO-Interface-1 (U8.AG13), VO-LCM-MIPI-DSI-TX0 (J8.12)
MIPI_DSI_TX0_D3_P: RK3568-VO-Interface-1 (U8.AH13), VO-LCM-MIPI-DSI-TX0 (J8.11)
NetC186_2: RK3568-VO-Interface-1 (C186.2 U8.AB18), VO-HDMI2.0-TX-Sheet (R123.1)
NetQ5_2: RK3568-SARADC-GPIO (U8.AH6), VO-HDMI2.0-TX-Sheet (Q5.2 R122.1)
NetQ6_3: RK3568-VO-Interface-2 (U8.AB8), WIFI-BT-SDIO-Sheet (Q6.3 R143.1)
NetR37_2: Power-Others-Sheet (R37.2), RK3568-Power-Sheet (U8.M15)
NetR84_1: RK3568-OSC-PMUIO-Sheet (U8.AE24), USB-Ports (R84.1)
NetR89_1: RK3568-Audio-Interface (U8.E20), LED-Debug-Sheet (R89.1)
NetR94_1: RK3568-Audio-Interface (U8.A21), LED-Debug-Sheet (R94.1)
NetR141_1: RK3568-VO-Interface-2 (U8.AH4), WIFI-BT-SDIO-Sheet (R141.1)
NetR142_1: RK3568-VO-Interface-2 (U8.AE5), WIFI-BT-SDIO-Sheet (R142.1)
NetR153_1: RK3568-VI-Interface-Sheet (U8.AA5), WIFI-BT-SDIO-Sheet (R153.1 U17.12)
NetR161_2: RK3568-SARADC-GPIO (U8.D26), WIFI-BT-SDIO-Sheet (R161.2)
NetR162_2: RK3568-SARADC-GPIO (U8.E25), WIFI-BT-SDIO-Sheet (R162.2)
NetR163_2: RK3568-OSC-PMUIO-Sheet (U8.AF25), Type-C-Sheet (R163.2)
NetR190_1: RK3568-VO-Interface-2 (U8.AC3), Sensors-Sheet-1 (R190.1)
NetR191_1: RK3568-VO-Interface-2 (U8.AC2), Sensors-Sheet-1 (R191.1)
NetR204_1: RK3568-OSC-PMUIO-Sheet (U8.AC22), Sensors-Sheet-1 (R204.1 U25.2)
NetU8_AA1: RK3568-VI-Interface-Sheet (U8.AA1), WIFI-BT-SDIO-Sheet (U17.13)
NetU8_AA7: RK3568-VO-Interface-2 (U8.AA7), Type-C-Sheet (U19.6)
NetU8_E26: RK3568-SARADC-GPIO (U8.E26), WIFI-BT-SDIO-Sheet (U17.42)
NetU8_F26: RK3568-SARADC-GPIO (U8.F26), WIFI-BT-SDIO-Sheet (U17.43)
NEUTRAL: Sensors-Sheet-2 (D39.2), Connector-Sheet (J6.18)
OIL_PRESSURE: Sensors-Sheet-2 (D40.2), Connector-Sheet (J6.3)
OIL_TEMP: Sensors-Sheet-2 (D38.2), Connector-Sheet (J6.2)
PDM_CLK0_M0_RK809: Power-PMIC-Sheet (U6.19), RK3568-Audio-Interface (U8.C20)
PMIC_INT_L: Power-PMIC-Sheet (U6.7), RK3568-OSC-PMUIO-Sheet (U8.AA22)
PMIC_SLEEP_H: Power-PMIC-Sheet (U6.49), Power-Others-Sheet (R35.2), RK3568-OSC-PMUIO-Sheet (U8.AG28)
RESETn: Power-PMIC-Sheet (C44.2 R23.1 R26.2 U6.67), RK3568-OSC-PMUIO-Sheet (C128.2 R45.1 U8.AH27)
RIGHT_TURN: Sensors-Sheet-2 (R206.1), Connector-Sheet (J6.15)
RK809_32KOUT_WIFI: Power-PMIC-Sheet (R17.2 R22.2), WIFI-BT-SDIO-Sheet (R160.1)
SARADC_VIN0_KEY/RECOVERY: RK3568-SARADC-GPIO (C156.1 P19.1 R60.2 U8.B27), LED-Debug-Sheet (C195.2 D11.2 R97.2 R98.2)
SDMMC2_CLK_M0: RK3568-VI-Interface-Sheet (U8.AC1), WIFI-BT-SDIO-Sheet (R149.1)
SDMMC2_CMD_M0: RK3568-VI-Interface-Sheet (U8.Y7), WIFI-BT-SDIO-Sheet (R139.2 R148.1)
SDMMC2_D0_M0: RK3568-VI-Interface-Sheet (U8.AC5), WIFI-BT-SDIO-Sheet (R135.2 R144.1)
SDMMC2_D1_M0: RK3568-VI-Interface-Sheet (U8.AA6), WIFI-BT-SDIO-Sheet (R136.2 R145.1)
SDMMC2_D2_M0: RK3568-VI-Interface-Sheet (U8.AB5), WIFI-BT-SDIO-Sheet (R137.2 R146.1)
SDMMC2_D3_M0: RK3568-VI-Interface-Sheet (U8.AB1), WIFI-BT-SDIO-Sheet (R138.2 R147.1)
SPARK_COIL: Sensors-Sheet-1 (R179.1), Connector-Sheet (J6.1)
SPEED_SENSOR: Sensors-Sheet-1 (R189.1 U21.3), Connector-Sheet (J6.7)
TYPEC0_CC0_INT_L: RK3568-OSC-PMUIO-Sheet (U8.AF23), Type-C-Sheet (R178.1 U20.5)
UART2_RX_M0_DEBUG: RK3568-OSC-PMUIO-Sheet (U8.AC20), LED-Debug-Sheet (R93.2)
UART2_TX_M0_DEBUG: RK3568-OSC-PMUIO-Sheet (U8.AH24), LED-Debug-Sheet (R92.2)
USB2_HOST3_D_N: RK3568-USB-PCIe-Sheet (U8.T1), USB-Ports (R87.1)
USB2_HOST3_D_P: RK3568-USB-PCIe-Sheet (U8.T2), USB-Ports (R88.1)
USB3_OTG0_D_N: RK3568-USB-PCIe-Sheet (U8.P28), Type-C-Sheet (L13.2)
USB3_OTG0_D_P: RK3568-USB-PCIe-Sheet (U8.P27), Type-C-Sheet (L13.1)
USB3_OTG0_SSRX_N: RK3568-USB-PCIe-Sheet (U8.R27), Type-C-Sheet (C284.2)
USB3_OTG0_SSRX_P: RK3568-USB-PCIe-Sheet (U8.R28), Type-C-Sheet (C285.2)
USB3_OTG0_SSTX_N: RK3568-USB-PCIe-Sheet (U8.T27), Type-C-Sheet (C282.2)
USB3_OTG0_SSTX_P: RK3568-USB-PCIe-Sheet (U8.T28), Type-C-Sheet (C283.2)
USB3_OTG0_VBUSDET: RK3568-USB-PCIe-Sheet (C141.2 U8.M24), Type-C-Sheet (R167.2 R168.2)